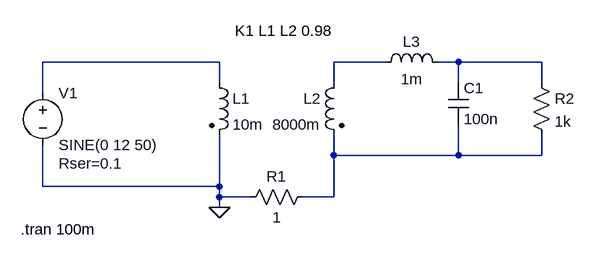
[diagram p0: schematic invertor_12V_230V.asc]
invertor_12V_230V.asc, the LTspice schematic file:
Version 4
SHEET 1 880 680
WIRE 48 80 -224 80
WIRE 304 80 224 80
WIRE 416 80 384 80
WIRE 544 80 416 80
WIRE 48 112 48 80
WIRE 224 112 224 80
WIRE 416 112 416 80
WIRE 544 112 544 80
WIRE -224 128 -224 80
WIRE 224 224 224 192
WIRE 416 224 416 176
WIRE 416 224 224 224
WIRE 544 224 544 192
WIRE 544 224 416 224
WIRE -224 272 -224 208
WIRE 48 272 48 192
WIRE 48 272 -224 272
WIRE 48 288 48 272
WIRE 96 288 48 288
WIRE 224 288 224 224
WIRE 224 288 176 288
WIRE 48 304 48 288
FLAG 48 304 0
SYMBOL ind2 32 96 R0
SYMATTR InstName L1
SYMATTR Value 10m
SYMATTR Type ind
SYMATTR SpiceLine Rser=0.1
SYMBOL ind2 240 96 M0
SYMATTR InstName L2
SYMATTR Value 8000m
SYMATTR Type ind
SYMATTR SpiceLine Rser=1
SYMBOL res 192 272 R90
WINDOW 0 0 56 VBottom 2
WINDOW 3 32 56 VTop 2
SYMATTR InstName R1
SYMATTR Value 1
SYMBOL ind 288 96 R270
WINDOW 0 32 56 VTop 2
WINDOW 3 5 56 VBottom 2
SYMATTR InstName L3
SYMATTR Value 1m
SYMATTR SpiceLine Rser=300m
SYMBOL cap 400 112 R0
SYMATTR InstName C1
SYMATTR Value 100n
SYMATTR SpiceLine Rser=50m
SYMBOL voltage -224 112 R0
WINDOW 123 0 0 Left 0
WINDOW 39 24 124 Left 2
SYMATTR InstName V1
SYMATTR Value SINE(0 12 50)
SYMATTR SpiceLine Rser=0.1
SYMBOL res 528 96 R0
SYMATTR InstName R2
SYMATTR Value 1k
TEXT 72 32 Left 2 !K1 L1 L2 0.98
TEXT -258 338 Left 2 !.tran 100m

The netlist it stands for:
* invertor_12V_230V.asc
L1 N001 0 10m Rser=0.1
L2 N002 N004 8000m Rser=1
R1 N004 0 1
L3 N002 N003 1m Rser=300m
C1 N003 N004 100n Rser=50m
V1 N001 0 SINE(0 12 50) Rser=0.1
R2 N003 N004 1k
K1 L1 L2 0.98
.tran 100m
.backanno
.end